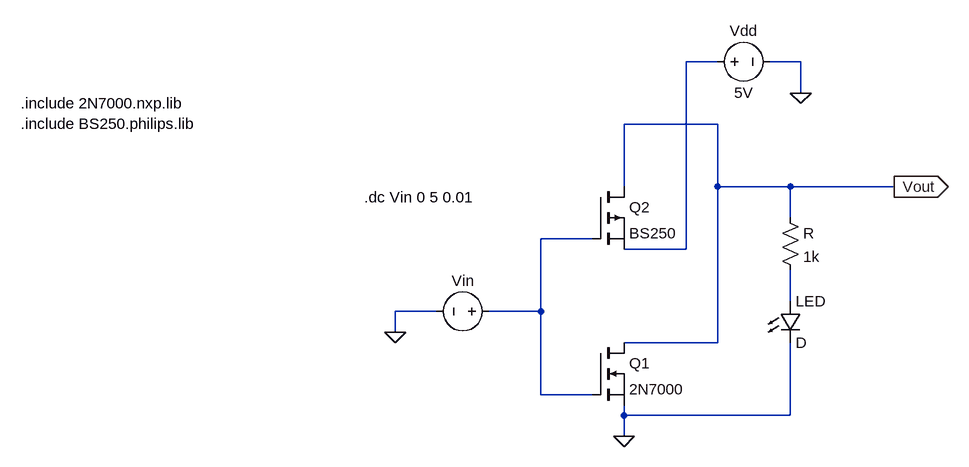
[diagram p0: schematic Inverter.asc]
Inverter.asc, the LTspice schematic file:
Version 4.1
SHEET 1 1056 680
WIRE 672 -208 624 -208
WIRE 800 -208 752 -208
WIRE 800 -160 800 -208
WIRE 672 -112 528 -112
WIRE 528 -16 528 -112
WIRE 672 -16 672 -112
WIRE 784 -16 672 -16
WIRE 944 -16 784 -16
WIRE 784 32 784 -16
WIRE 480 64 400 64
WIRE 624 80 624 -208
WIRE 624 80 528 80
WIRE 784 160 784 112
WIRE 240 176 176 176
WIRE 400 176 400 64
WIRE 400 176 320 176
WIRE 176 208 176 176
WIRE 672 224 672 -16
WIRE 672 224 528 224
WIRE 400 304 400 176
WIRE 480 304 400 304
WIRE 528 336 528 320
WIRE 784 336 784 224
WIRE 784 336 528 336
WIRE 528 368 528 336
FLAG 800 -160 0
FLAG 528 368 0
FLAG 176 208 0
FLAG 944 -16 Vout
IOPIN 944 -16 Out
SYMBOL pmos 480 -16 R0
SYMATTR InstName Q2
SYMATTR Value BS250
SYMATTR Prefix X
SYMBOL nmos 480 224 R0
SYMATTR InstName Q1
SYMATTR Value 2N7000
SYMATTR Prefix X
SYMBOL voltage 656 -208 R270
WINDOW 0 32 56 VTop 2
WINDOW 3 -32 56 VBottom 2
WINDOW 123 0 0 Left 0
WINDOW 39 0 0 Left 0
SYMATTR InstName Vdd
SYMATTR Value 5V
SYMBOL voltage 336 176 R90
WINDOW 0 -32 56 VBottom 2
WINDOW 3 32 56 VTop 2
SYMATTR InstName Vin
SYMATTR Value ""
SYMBOL LED 768 160 R0
SYMATTR InstName LED
SYMBOL res 768 16 R0
SYMATTR InstName R
SYMATTR Value 1k
TEXT -400 -144 Left 2 !.include 2N7000.nxp.lib\n.include BS250.philips.lib
TEXT 128 0 Left 2 !.dc Vin 0 5 0.01

The netlist it stands for:
* Inverter.asc
X§Q2 Vout N002 N001 BS250  ; pins D G S
X§Q1 Vout N002 0 2N7000  ; pins D G S
Vdd N001 0 5V
Vin N002 0
D§LED N003 0 D
R Vout N003 1k
.model D D
.lib standard.dio
.include 2N7000.nxp.lib
.include BS250.philips.lib
.dc Vin 0 5 0.01
.backanno
.end